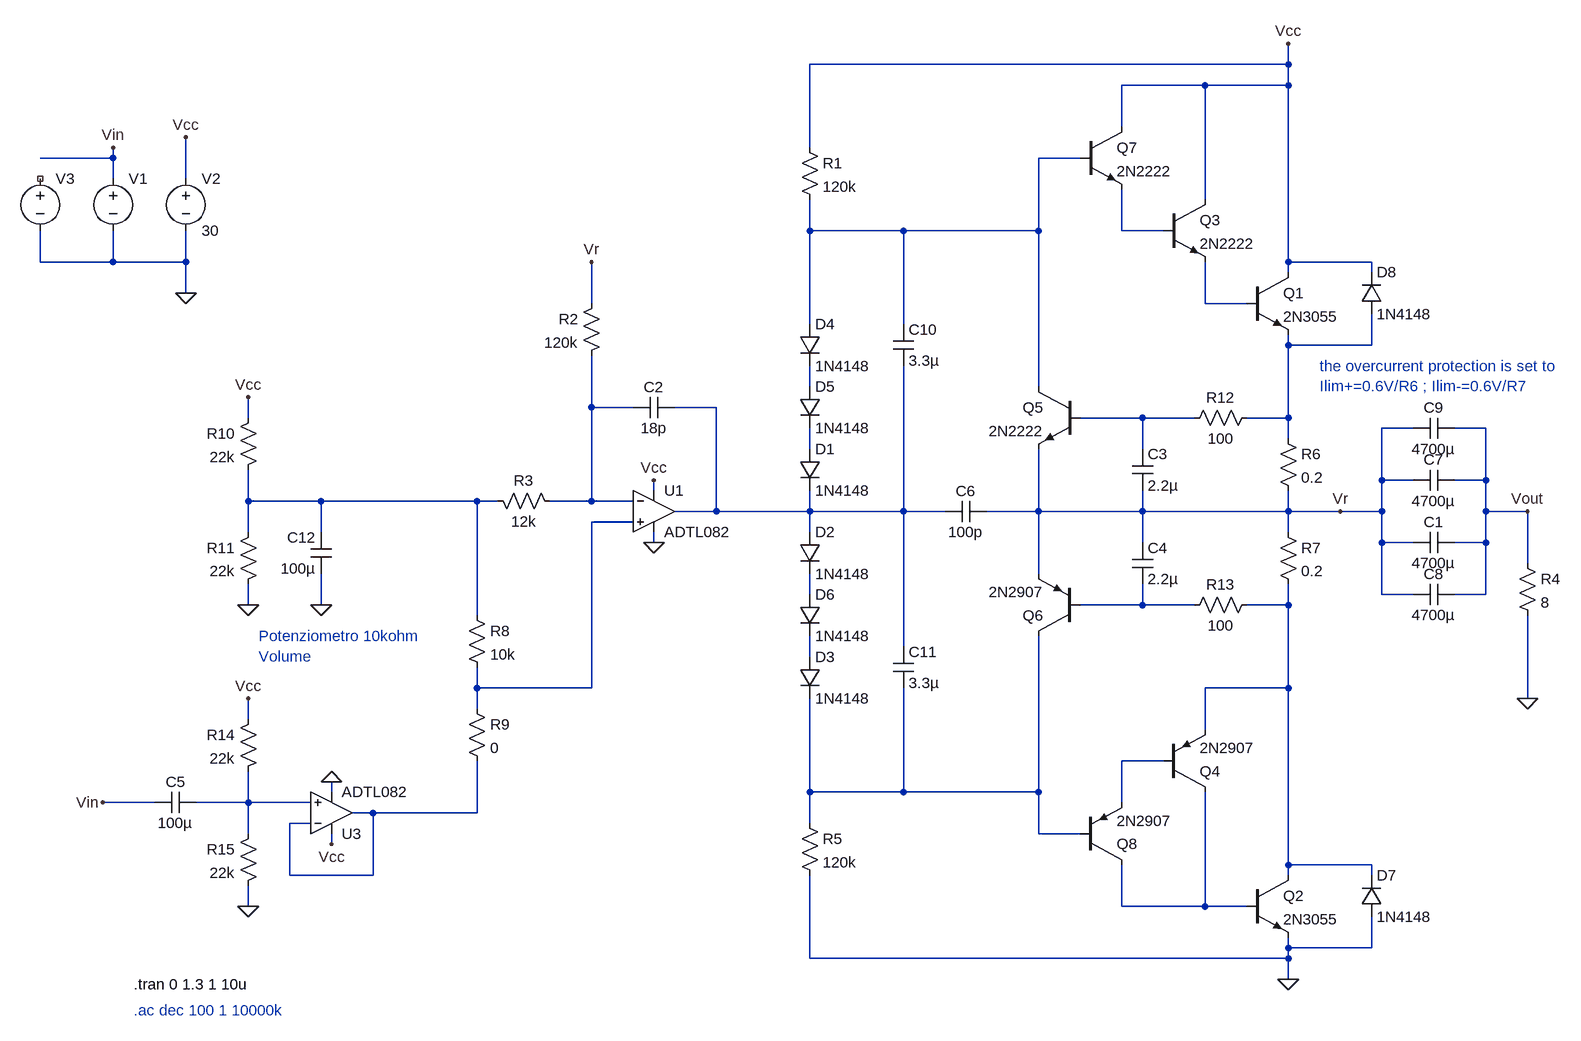
[diagram p0: schematic AB amplifier v3.asc]
AB amplifier v3.asc, the LTspice schematic file:
Version 4.1
SHEET 1 1812 848
WIRE 784 -624 784 -656
WIRE 784 -624 48 -624
WIRE 656 -592 528 -592
WIRE 784 -592 784 -624
WIRE 784 -592 656 -592
WIRE 528 -528 528 -592
WIRE 48 -496 48 -624
WIRE -1024 -480 -1024 -496
WIRE -1024 -480 -1136 -480
WIRE 464 -480 400 -480
WIRE -1024 -448 -1024 -480
WIRE -912 -448 -912 -512
WIRE 656 -416 656 -592
WIRE 48 -368 48 -416
WIRE 192 -368 48 -368
WIRE 400 -368 400 -480
WIRE 400 -368 192 -368
WIRE 528 -368 528 -432
WIRE 592 -368 528 -368
WIRE -1136 -320 -1136 -368
WIRE -1024 -320 -1024 -368
WIRE -1024 -320 -1136 -320
WIRE -912 -320 -912 -368
WIRE -912 -320 -1024 -320
WIRE 784 -320 784 -592
WIRE 912 -320 784 -320
WIRE 784 -304 784 -320
WIRE 912 -304 912 -320
WIRE -912 -272 -912 -320
WIRE -288 -256 -288 -320
WIRE 656 -256 656 -320
WIRE 720 -256 656 -256
WIRE 48 -224 48 -368
WIRE 192 -224 192 -368
WIRE 784 -192 784 -208
WIRE 912 -192 912 -240
WIRE 912 -192 784 -192
WIRE 48 -128 48 -160
WIRE 400 -128 400 -368
WIRE -288 -96 -288 -176
WIRE -224 -96 -288 -96
WIRE -96 -96 -160 -96
WIRE -816 -80 -816 -112
WIRE 560 -80 464 -80
WIRE 640 -80 560 -80
WIRE 784 -80 784 -192
WIRE 784 -80 720 -80
WIRE 976 -64 928 -64
WIRE 1088 -64 1040 -64
WIRE 784 -48 784 -80
WIRE 48 -32 48 -64
WIRE 560 -32 560 -80
WIRE 928 16 928 -64
WIRE 976 16 928 16
WIRE 1088 16 1088 -64
WIRE 1088 16 1040 16
WIRE -192 32 -192 16
WIRE -816 48 -816 0
WIRE -704 48 -816 48
WIRE -464 48 -704 48
WIRE -432 48 -464 48
WIRE -288 48 -288 -96
WIRE -288 48 -352 48
WIRE -224 48 -288 48
WIRE -96 64 -96 -96
WIRE -96 64 -160 64
WIRE 48 64 48 32
WIRE 48 64 -96 64
WIRE 192 64 192 -160
WIRE 192 64 48 64
WIRE 256 64 192 64
WIRE 400 64 400 -32
WIRE 400 64 320 64
WIRE 560 64 560 32
WIRE 560 64 400 64
WIRE 784 64 784 32
WIRE 784 64 560 64
WIRE 864 64 784 64
WIRE 928 64 928 16
WIRE 928 64 864 64
WIRE 1088 64 1088 16
WIRE 1152 64 1088 64
WIRE -224 80 -288 80
WIRE -816 96 -816 48
WIRE -704 96 -704 48
WIRE 48 96 48 64
WIRE 784 96 784 64
WIRE -192 112 -192 96
WIRE 560 112 560 64
WIRE 928 112 928 64
WIRE 976 112 928 112
WIRE 1088 112 1088 64
WIRE 1088 112 1040 112
WIRE 1152 144 1152 64
WIRE 400 160 400 64
WIRE 48 192 48 160
WIRE 928 192 928 112
WIRE 976 192 928 192
WIRE 1088 192 1088 112
WIRE 1088 192 1040 192
WIRE -816 208 -816 176
WIRE -704 208 -704 160
WIRE 560 208 560 176
WIRE 560 208 464 208
WIRE 640 208 560 208
WIRE 784 208 784 176
WIRE 784 208 720 208
WIRE -464 224 -464 48
WIRE 192 272 192 64
WIRE 48 288 48 256
WIRE -464 336 -464 304
WIRE -288 336 -288 80
WIRE -288 336 -464 336
WIRE 784 336 784 208
WIRE 784 336 656 336
WIRE 1152 352 1152 224
WIRE -464 368 -464 336
WIRE -816 384 -816 352
WIRE 656 400 656 336
WIRE 592 448 528 448
WIRE -688 496 -688 480
WIRE 48 496 48 352
WIRE 192 496 192 336
WIRE 192 496 48 496
WIRE 400 496 400 256
WIRE 400 496 192 496
WIRE -960 512 -1040 512
WIRE -816 512 -816 464
WIRE -816 512 -896 512
WIRE -720 512 -816 512
WIRE 528 512 528 448
WIRE -624 528 -656 528
WIRE -464 528 -464 448
WIRE -464 528 -624 528
WIRE -720 544 -752 544
WIRE 48 544 48 496
WIRE -816 560 -816 512
WIRE 400 560 400 496
WIRE 464 560 400 560
WIRE -688 576 -688 560
WIRE 784 608 784 336
WIRE 912 608 784 608
WIRE -752 624 -752 544
WIRE -624 624 -624 528
WIRE -624 624 -752 624
WIRE 784 624 784 608
WIRE 912 624 912 608
WIRE -816 672 -816 640
WIRE 528 672 528 608
WIRE 656 672 656 496
WIRE 656 672 528 672
WIRE 720 672 656 672
WIRE 784 736 784 720
WIRE 912 736 912 688
WIRE 912 736 784 736
WIRE 48 752 48 624
WIRE 784 752 784 736
WIRE 784 752 48 752
WIRE 784 784 784 752
FLAG -192 16 Vcc
FLAG -288 -320 Vr
FLAG -912 -512 Vcc
FLAG 1152 64 Vout
FLAG -192 112 0
FLAG 1152 352 0
FLAG -912 -272 0
FLAG -1024 -496 Vin
FLAG 864 64 Vr
FLAG 784 784 0
FLAG 784 -656 Vcc
FLAG -816 352 Vcc
FLAG -816 672 0
FLAG -1040 512 Vin
FLAG -688 576 Vcc
FLAG -688 480 0
FLAG -816 -112 Vcc
FLAG -816 208 0
FLAG -704 208 0
SYMBOL npn 720 -304 R0
SYMATTR InstName Q1
SYMATTR Value 2N3055
SYMBOL npn 592 -416 R0
SYMATTR InstName Q3
SYMATTR Value 2N2222
SYMBOL pnp 592 496 M180
SYMATTR InstName Q4
SYMATTR Value 2N2907
SYMBOL res 32 -512 R0
SYMATTR InstName R1
SYMATTR Value 120k
SYMBOL diode 32 -32 R0
SYMATTR InstName D1
SYMATTR Value 1N4148
SYMBOL diode 32 96 R0
SYMATTR InstName D2
SYMATTR Value 1N4148
SYMBOL diode 32 288 R0
SYMATTR InstName D3
SYMATTR Value 1N4148
SYMBOL OpAmps\\ADTL082 -192 0 R0
SYMATTR InstName U1
SYMBOL res -272 -272 M0
SYMATTR InstName R2
SYMATTR Value 120k
SYMBOL res -448 32 M90
WINDOW 0 0 56 VBottom 2
WINDOW 3 32 56 VTop 2
SYMATTR InstName R3
SYMATTR Value 12k
SYMBOL res 1136 128 R0
SYMATTR InstName R4
SYMATTR Value 8
SYMBOL voltage -1024 -464 R0
WINDOW 3 24 96 Invisible 2
WINDOW 39 0 0 Left 0
SYMATTR Value SINE(0 0.7 20)
SYMATTR InstName V1
SYMATTR Value2 AC 1 0
SYMBOL voltage -912 -464 R0
WINDOW 123 0 0 Left 0
WINDOW 39 0 0 Left 0
SYMATTR InstName V2
SYMATTR Value 30
SYMBOL res 32 528 R0
SYMATTR InstName R5
SYMATTR Value 120k
SYMBOL diode 32 -224 R0
SYMATTR InstName D4
SYMATTR Value 1N4148
SYMBOL cap 1040 96 R90
WINDOW 0 0 32 VBottom 2
WINDOW 3 32 32 VTop 2
SYMATTR InstName C1
SYMATTR Value 4700µ
SYMBOL cap -160 -80 M270
WINDOW 0 32 32 VTop 2
WINDOW 3 0 32 VBottom 2
SYMATTR InstName C2
SYMATTR Value 18p
SYMBOL res 768 -64 R0
SYMATTR InstName R6
SYMATTR Value 0.2
SYMBOL res 768 80 R0
SYMATTR InstName R7
SYMATTR Value 0.2
SYMBOL npn 464 -128 M0
SYMATTR InstName Q5
SYMATTR Value 2N2222
SYMBOL npn 720 624 R0
SYMATTR InstName Q2
SYMATTR Value 2N3055
SYMBOL res 736 -96 R90
WINDOW 0 0 56 VBottom 2
WINDOW 3 32 56 VTop 2
SYMATTR InstName R12
SYMATTR Value 100
SYMBOL cap 544 -32 R0
SYMATTR InstName C3
SYMATTR Value 2.2µ
SYMBOL pnp 464 256 R180
SYMATTR InstName Q6
SYMATTR Value 2N2907
SYMBOL res 736 192 R90
WINDOW 0 0 56 VBottom 2
WINDOW 3 32 56 VTop 2
SYMATTR InstName R13
SYMATTR Value 100
SYMBOL cap 544 112 R0
SYMATTR InstName C4
SYMATTR Value 2.2µ
SYMBOL voltage -1136 -464 R0
WINDOW 3 24 96 Invisible 2
WINDOW 39 0 0 Left 0
SYMATTR Value PWL(0 0 1m 0 10m 5)
SYMATTR InstName V3
SYMATTR Value2 AC 0 0
SYMBOL npn 464 -528 R0
SYMATTR InstName Q7
SYMATTR Value 2N2222
SYMBOL pnp 464 608 M180
SYMATTR InstName Q8
SYMATTR Value 2N2907
SYMBOL diode 32 -128 R0
SYMATTR InstName D5
SYMATTR Value 1N4148
SYMBOL diode 32 192 R0
SYMATTR InstName D6
SYMATTR Value 1N4148
SYMBOL res -480 208 R0
SYMATTR InstName R8
SYMATTR Value 10k
SYMBOL res -480 352 R0
SYMATTR InstName R9
SYMATTR Value 0
SYMBOL res -800 368 M0
SYMATTR InstName R14
SYMATTR Value 22k
SYMBOL res -800 544 M0
SYMATTR InstName R15
SYMATTR Value 22k
SYMBOL cap -896 496 R90
WINDOW 0 0 32 VBottom 2
WINDOW 3 32 32 VTop 2
SYMATTR InstName C5
SYMATTR Value 100µ
SYMBOL OpAmps\\ADTL082 -688 592 M180
SYMATTR InstName U3
SYMBOL res -800 -96 M0
SYMATTR InstName R10
SYMATTR Value 22k
SYMBOL res -800 80 M0
SYMATTR InstName R11
SYMATTR Value 22k
SYMBOL cap 320 48 R90
WINDOW 0 0 32 VBottom 2
WINDOW 3 32 32 VTop 2
SYMATTR InstName C6
SYMATTR Value 100p
SYMBOL cap 1040 0 R90
WINDOW 0 0 32 VBottom 2
WINDOW 3 32 32 VTop 2
SYMATTR InstName C7
SYMATTR Value 4700µ
SYMBOL cap 1040 176 R90
WINDOW 0 0 32 VBottom 2
WINDOW 3 32 32 VTop 2
SYMATTR InstName C8
SYMATTR Value 4700µ
SYMBOL cap 1040 -80 R90
WINDOW 0 0 32 VBottom 2
WINDOW 3 32 32 VTop 2
SYMATTR InstName C9
SYMATTR Value 4700µ
SYMBOL diode 896 688 M180
WINDOW 0 24 64 Left 2
WINDOW 3 24 0 Left 2
SYMATTR InstName D7
SYMATTR Value 1N4148
SYMBOL diode 896 -240 M180
WINDOW 0 24 64 Left 2
WINDOW 3 24 0 Left 2
SYMATTR InstName D8
SYMATTR Value 1N4148
SYMBOL cap 176 -160 M180
WINDOW 0 24 56 Left 2
WINDOW 3 24 8 Left 2
SYMATTR InstName C10
SYMATTR Value 3.3µ
SYMBOL cap 176 336 M180
WINDOW 0 24 56 Left 2
WINDOW 3 24 8 Left 2
SYMATTR InstName C11
SYMATTR Value 3.3µ
SYMBOL cap -688 160 R180
WINDOW 0 24 56 Left 2
WINDOW 3 24 8 Left 2
SYMATTR InstName C12
SYMATTR Value 100µ
TEXT -992 792 Left 2 !.tran 0 1.3 1 10u
TEXT -992 832 Left 2 ;.ac dec 100 1 10000k
TEXT 832 -160 Left 2 ;the overcurrent protection is set to\nIlim+=0.6V/R6 ; Ilim-=0.6V/R7
TEXT -800 256 Left 2 ;Potenziometro 10kohm\nVolume

The netlist it stands for:
* AB amplifier v3.asc
Q1 Vcc N003 N004 0 2N3055
Q3 Vcc N002 N003 0 2N2222
Q4 N020 N016 N014 0 2N2907
R1 Vcc N001 120k
D1 N009 N007 1N4148
D2 N007 N012 1N4148
D3 N015 N017 1N4148
X§U1 N011 N006 Vcc 0 N007 ADTL082  ; pins In+ In- V+ V- OUT
R2 Vr N006 120k
R3 N010 N006 12k
R4 Vout 0 8
V1 Vin 0 SINE(0 0.7 20) AC 1 0
V2 Vcc 0 30
R5 N017 0 120k
D4 N001 N005 1N4148
C1 Vout Vr 4700µ
C2 N007 N006 18p
R6 N004 Vr 0.2
R7 Vr N014 0.2
Q5 N001 N008 Vr 0 2N2222
Q2 N014 N020 0 0 2N3055
R12 N004 N008 100
C3 N008 Vr 2.2µ
Q6 N017 N013 Vr 0 2N2907
R13 N014 N013 100
C4 Vr N013 2.2µ
V3 NC_01 0 PWL(0 0 1m 0 10m 5) AC 0 0
Q7 Vcc N001 N002 0 2N2222
Q8 N020 N017 N016 0 2N2907
D5 N005 N009 1N4148
D6 N012 N015 1N4148
R8 N010 N011 10k
R9 N011 N019 0
R14 Vcc N018 22k
R15 N018 0 22k
C5 N018 Vin 100µ
X§U3 N018 N019 Vcc 0 N019 ADTL082  ; pins In+ In- V+ V- OUT
R10 Vcc N010 22k
R11 N010 0 22k
C6 Vr N007 100p
C7 Vout Vr 4700µ
C8 Vout Vr 4700µ
C9 Vout Vr 4700µ
D7 0 N014 1N4148
D8 N004 Vcc 1N4148
C10 N007 N001 3.3µ
C11 N017 N007 3.3µ
C12 0 N010 100µ
.model D D
.lib standard.dio
.model NPN NPN
.model PNP PNP
.lib standard.bjt
.tran 0 1.3 1 10u
* .ac dec 100 1 10000k
* the overcurrent protection is set to
* Ilim+=0.6V/R6 ; Ilim-=0.6V/R7
* Potenziometro 10kohm
* Volume
.lib ADI.lib
.backanno
.end